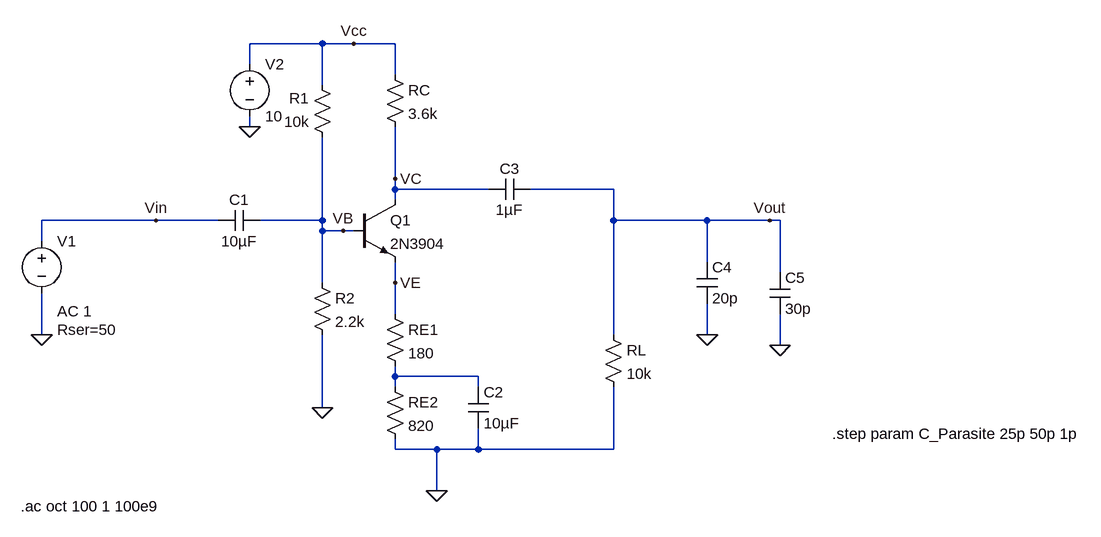
[diagram p0: schematic TP2.asc]
TP2.asc, the LTspice schematic file:
Version 4
SHEET 1 7796 1108
WIRE 208 -240 96 -240
WIRE 256 -240 208 -240
WIRE 320 -240 256 -240
WIRE 96 -208 96 -240
WIRE 320 -192 320 -240
WIRE 208 -176 208 -240
WIRE 96 -112 96 -128
WIRE 320 -32 320 -112
WIRE 320 -16 320 -32
WIRE 464 -16 320 -16
WIRE 656 -16 528 -16
WIRE 320 0 320 -16
WIRE -48 32 -224 32
WIRE 48 32 -48 32
WIRE 208 32 208 -96
WIRE 208 32 112 32
WIRE 656 32 656 -16
WIRE 800 32 656 32
WIRE 896 32 800 32
WIRE 912 32 896 32
WIRE 208 48 208 32
WIRE 240 48 208 48
WIRE 256 48 240 48
WIRE -224 64 -224 32
WIRE 800 96 800 32
WIRE 912 112 912 32
WIRE 208 128 208 48
WIRE 320 128 320 96
WIRE 320 176 320 128
WIRE -224 208 -224 144
WIRE 656 208 656 32
WIRE 800 208 800 160
WIRE 912 224 912 176
WIRE 320 272 320 256
WIRE 448 272 320 272
WIRE 320 288 320 272
WIRE 448 288 448 272
WIRE 208 320 208 208
WIRE 320 384 320 368
WIRE 384 384 320 384
WIRE 448 384 448 352
WIRE 448 384 384 384
WIRE 656 384 656 288
WIRE 656 384 448 384
WIRE 384 448 384 384
FLAG 96 -112 0
FLAG -224 208 0
FLAG 208 320 0
FLAG 384 448 0
FLAG 320 128 VE
FLAG 320 -32 VC
FLAG 240 48 VB
FLAG 256 -240 Vcc
FLAG 800 208 0
FLAG 912 224 0
FLAG -48 32 Vin
FLAG 896 32 Vout
SYMBOL voltage -224 48 R0
WINDOW 123 24 124 Left 2
WINDOW 39 24 152 Left 2
SYMATTR Value2 AC 1
SYMATTR SpiceLine Rser=50
SYMATTR InstName V1
SYMATTR Value ""
SYMBOL res 304 272 R0
SYMATTR InstName RE2
SYMATTR Value 820
SYMBOL res 304 160 R0
SYMATTR InstName RE1
SYMATTR Value 180
SYMBOL cap 112 16 R90
WINDOW 0 0 32 VBottom 2
WINDOW 3 32 32 VTop 2
SYMATTR InstName C1
SYMATTR Value 10µF
SYMBOL cap 528 -32 R90
WINDOW 0 0 32 VBottom 2
WINDOW 3 32 32 VTop 2
SYMATTR InstName C3
SYMATTR Value 1µF
SYMBOL res 640 192 R0
SYMATTR InstName RL
SYMATTR Value 10k
SYMBOL res 304 -208 R0
SYMATTR InstName RC
SYMATTR Value 3.6k
SYMBOL res 224 -80 R180
WINDOW 0 36 76 Left 2
WINDOW 3 36 40 Left 2
SYMATTR InstName R1
SYMATTR Value 10k
SYMBOL voltage 96 -224 R0
WINDOW 123 0 0 Left 0
WINDOW 39 0 0 Left 0
SYMATTR InstName V2
SYMATTR Value 10
SYMBOL res 192 112 R0
SYMATTR InstName R2
SYMATTR Value 2.2k
SYMBOL cap 432 288 R0
SYMATTR InstName C2
SYMATTR Value 10µF
SYMBOL npn 256 0 R0
SYMATTR InstName Q1
SYMATTR Value 2N3904
SYMBOL cap 784 96 R0
SYMATTR InstName C4
SYMATTR Value 20p
SYMBOL cap 896 112 R0
SYMATTR InstName C5
SYMATTR Value 30p
TEXT -256 472 Left 2 !.ac oct 100 1 100e9
TEXT 992 360 Left 2 !.step param C_Parasite 25p 50p 1p

The netlist it stands for:
* TP2.asc
V1 Vin 0 AC 1 Rser=50
RE2 N001 0 820
RE1 VE N001 180
C1 VB Vin 10µF
C3 Vout VC 1µF
RL Vout 0 10k
RC Vcc VC 3.6k
R1 VB Vcc 10k
V2 Vcc 0 10
R2 VB 0 2.2k
C2 N001 0 10µF
Q1 VC VB VE 0 2N3904
C4 Vout 0 20p
C5 Vout 0 30p
.model NPN NPN
.model PNP PNP
.lib standard.bjt
.ac oct 100 1 100e9
.step param C_Parasite 25p 50p 1p
.backanno
.end